# EasyEDA Pro project MSX-ROM-CARTRIDGE.epro

# Schematic MSX-ROM-CARTRIDGE
Board Name: MSX-ROM-CARTRIDGE; Create Date: 2026-04-04; Page Name: P1; Project Name: TURBO-CPU; Schematic Name: MSX-ROM-CARTRIDGE; Update Date: 2026-04-04; Version: V1.0
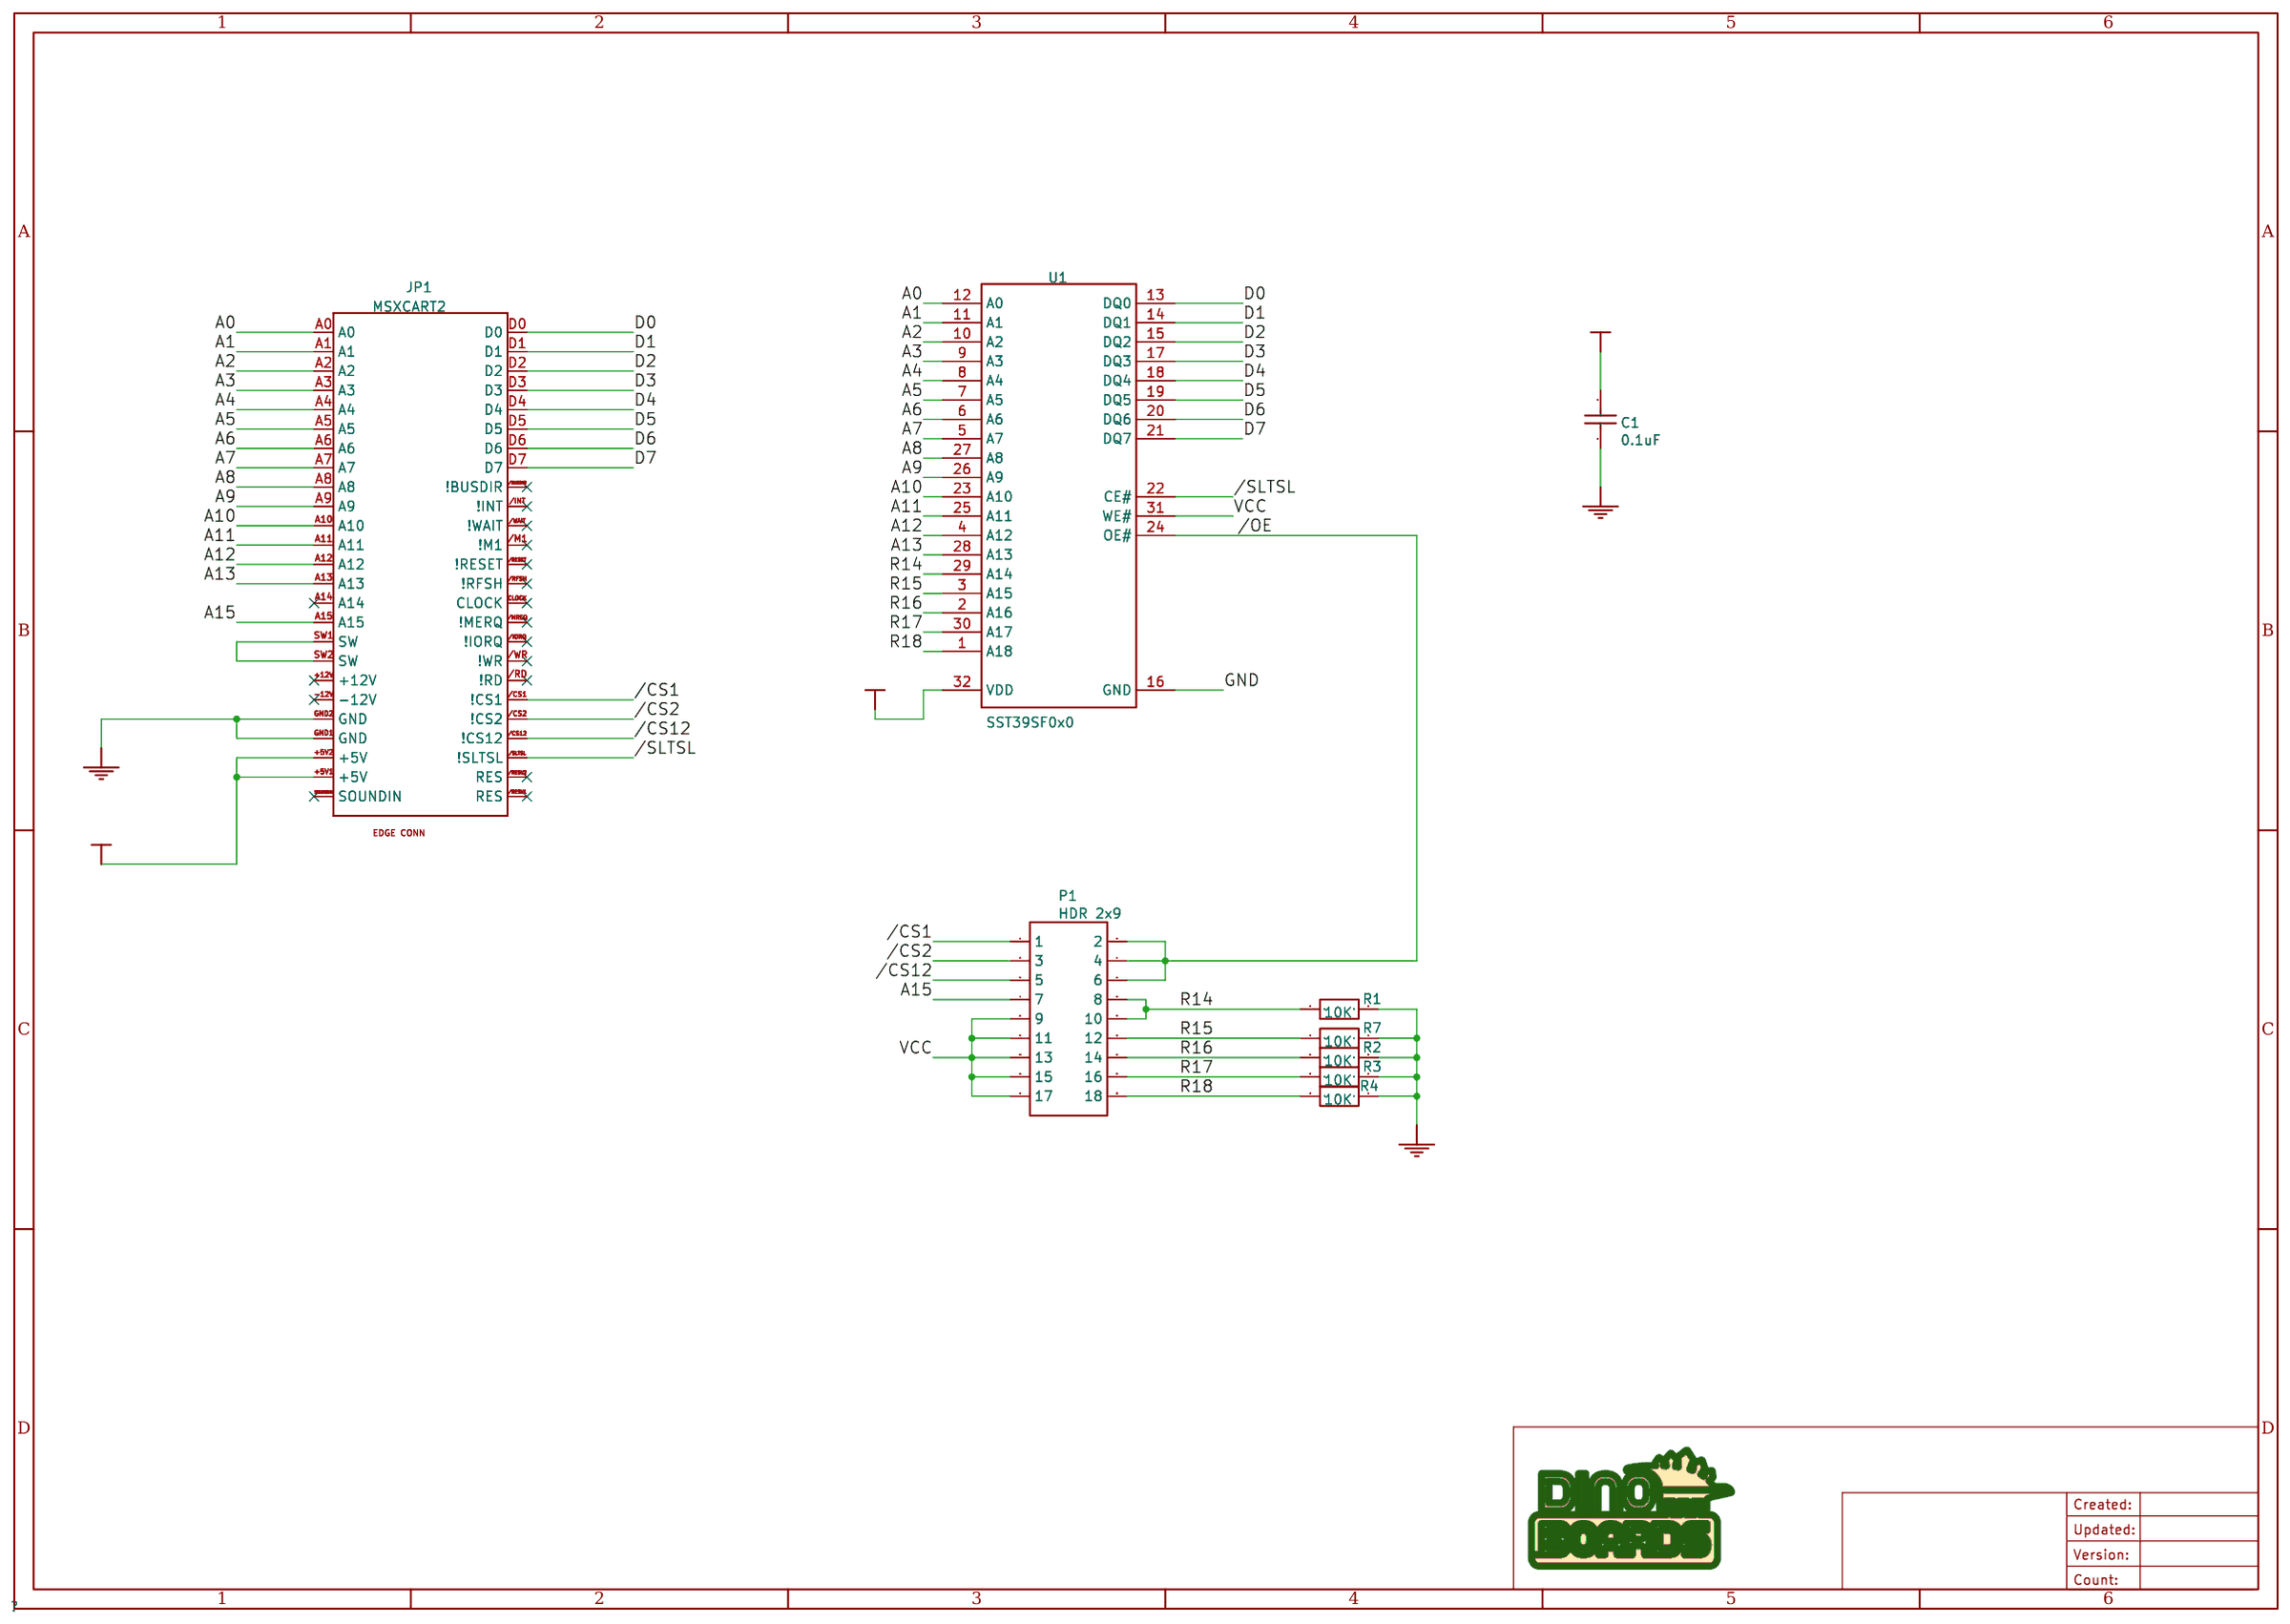
[diagram p0: schematic sheet]

## Parts
C1  0.1uF  [RAD-0.1]
JP1  MSXCART2  [DINO-MSXCART]
P1  HDR 2x9  [HDR 2X9]
R1  10K  [DINO-RESISTOR-250W]
R2  10K  [DINO-RESISTOR-250W]
R3  10K  [DINO-RESISTOR-250W]
R4  10K  [DINO-RESISTOR-250W]
R7  10K  [DINO-RESISTOR-250W]
U1  SST39SF0x0  [DINO-DIP32]

## Library data of the parts
C1 = 0.1uF: Manufacturer Part: Ceramic capacitor0.1UF50V; nameAlias: Capacitance; Contributor: dearali; spicePre: C; spiceSymbolName: SR201C104
JP1 = MSXCART2: timeStamp: 1460482699; Contributor: ageikin.v92; spicePre: J
P1 = HDR 2x9: Contributor: Alex_Tien; spicePre: P
R1-R4 R7 = 10K: nameAlias: Value(Ω); Contributor: LCEDA_Lib; spicePre: R; spiceSymbolName: R_AXIAL-0.3_EU
U1 = SST39SF0x0: spicePre: U; spiceSymbolName: SST39SF040-70-4C-PHE

## Nets
GND: C1.1 JP1.GND1(GND) JP1.GND2(GND) R1.1 R2.1 R3.1 R4.1 R7.1 U1.16(GND)
VCC: C1.2 JP1.+5V1(+5V) JP1.+5V2(+5V) P1.9 P1.11 P1.13 P1.15 P1.17 U1.31(WE#) U1.32(VDD)
/CS1: JP1./CS1(!CS1) P1.1
/CS2: JP1./CS2(!CS2) P1.3
/CS12: JP1./CS12(!CS12) P1.5
/OE: P1.2 P1.4 P1.6 U1.24(OE#)
/SLTSL: JP1./SLTSL(!SLTSL) U1.22(CE#)
A0: JP1.A0 U1.12(A0)
A1: JP1.A1 U1.11(A1)
A2: JP1.A2 U1.10(A2)
A3: JP1.A3 U1.9(A3)
A4: JP1.A4 U1.8(A4)
A5: JP1.A5 U1.7(A5)
A6: JP1.A6 U1.6(A6)
A7: JP1.A7 U1.5(A7)
A8: JP1.A8 U1.27(A8)
A9: JP1.A9 U1.26(A9)
A10: JP1.A10 U1.23(A10)
A11: JP1.A11 U1.25(A11)
A12: JP1.A12 U1.4(A12)
A13: JP1.A13 U1.28(A13)
A15: JP1.A15 P1.7
D0: JP1.D0 U1.13(DQ0)
D1: JP1.D1 U1.14(DQ1)
D2: JP1.D2 U1.15(DQ2)
D3: JP1.D3 U1.17(DQ3)
D4: JP1.D4 U1.18(DQ4)
D5: JP1.D5 U1.19(DQ5)
D6: JP1.D6 U1.20(DQ6)
D7: JP1.D7 U1.21(DQ7)
R14: P1.8 P1.10 R1.2 U1.29(A14)
R15: P1.12 R7.2 U1.3(A15)
R16: P1.14 R2.2 U1.2(A16)
R17: P1.16 R3.2 U1.30(A17)
R18: P1.18 R4.2 U1.1(A18)
$1N52: JP1.SW1(SW) JP1.SW2(SW)

Not connected (* = marked no-connect by the designer): JP1 +12V* -12V* /BUSDIR(!BUSDIR)* /INT(!INT)* /IORQ(!IORQ)* /M1(!M1)* /MREQ(!MERQ)* /RD(!RD)* /RESET(!RESET)* /RESV1(RES)* /RESV2(RES)* /RFSH(!RFSH)* /WAIT(!WAIT)* /WR(!WR)* A14* CLOCK* SOUNDIN*

# Board MSX-ROM-CARTRIDGE
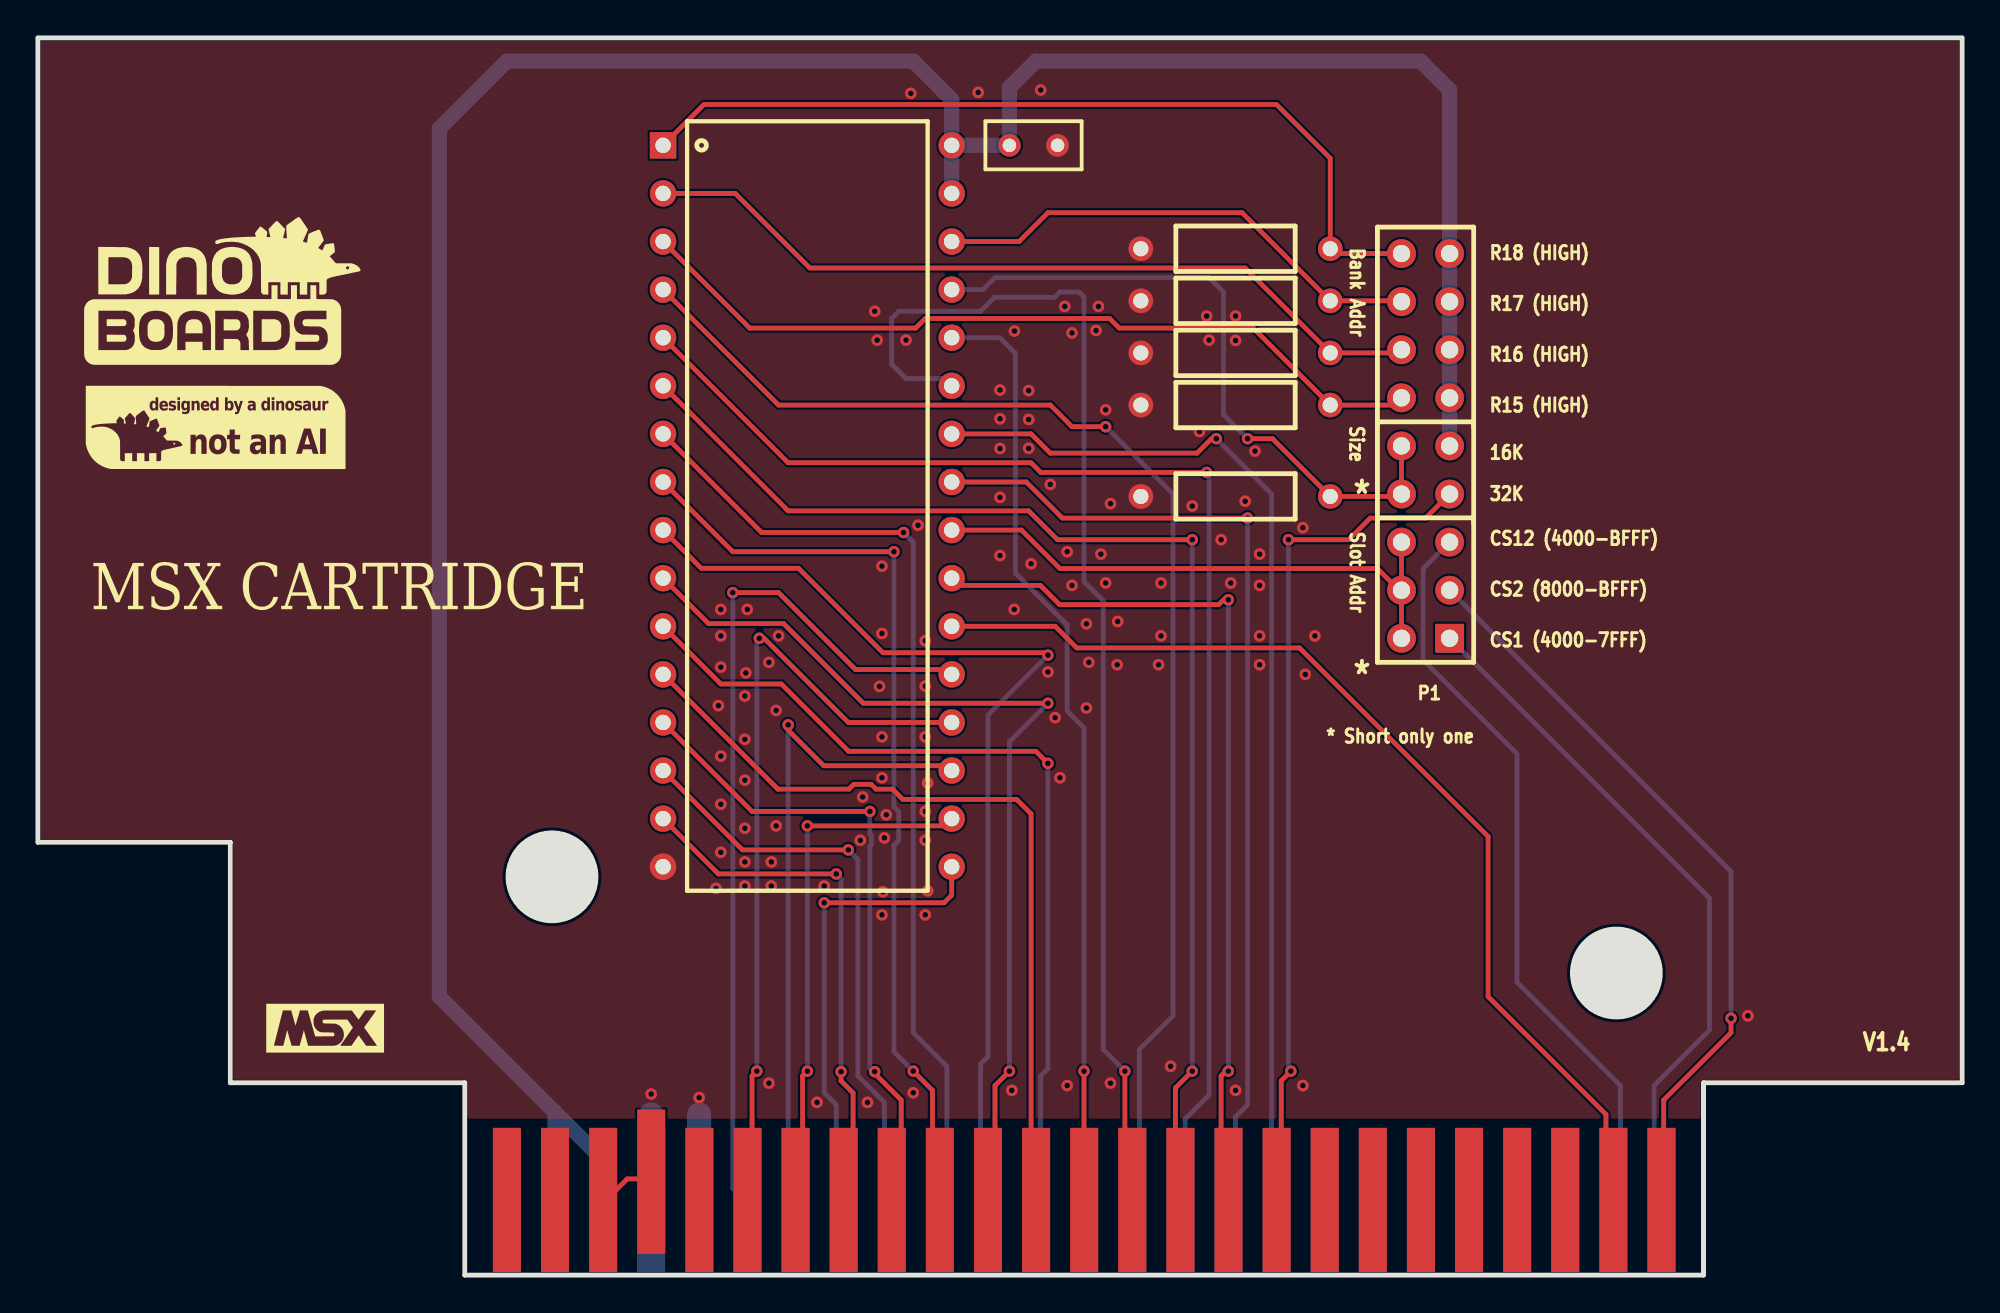
[diagram p1: board, top side]
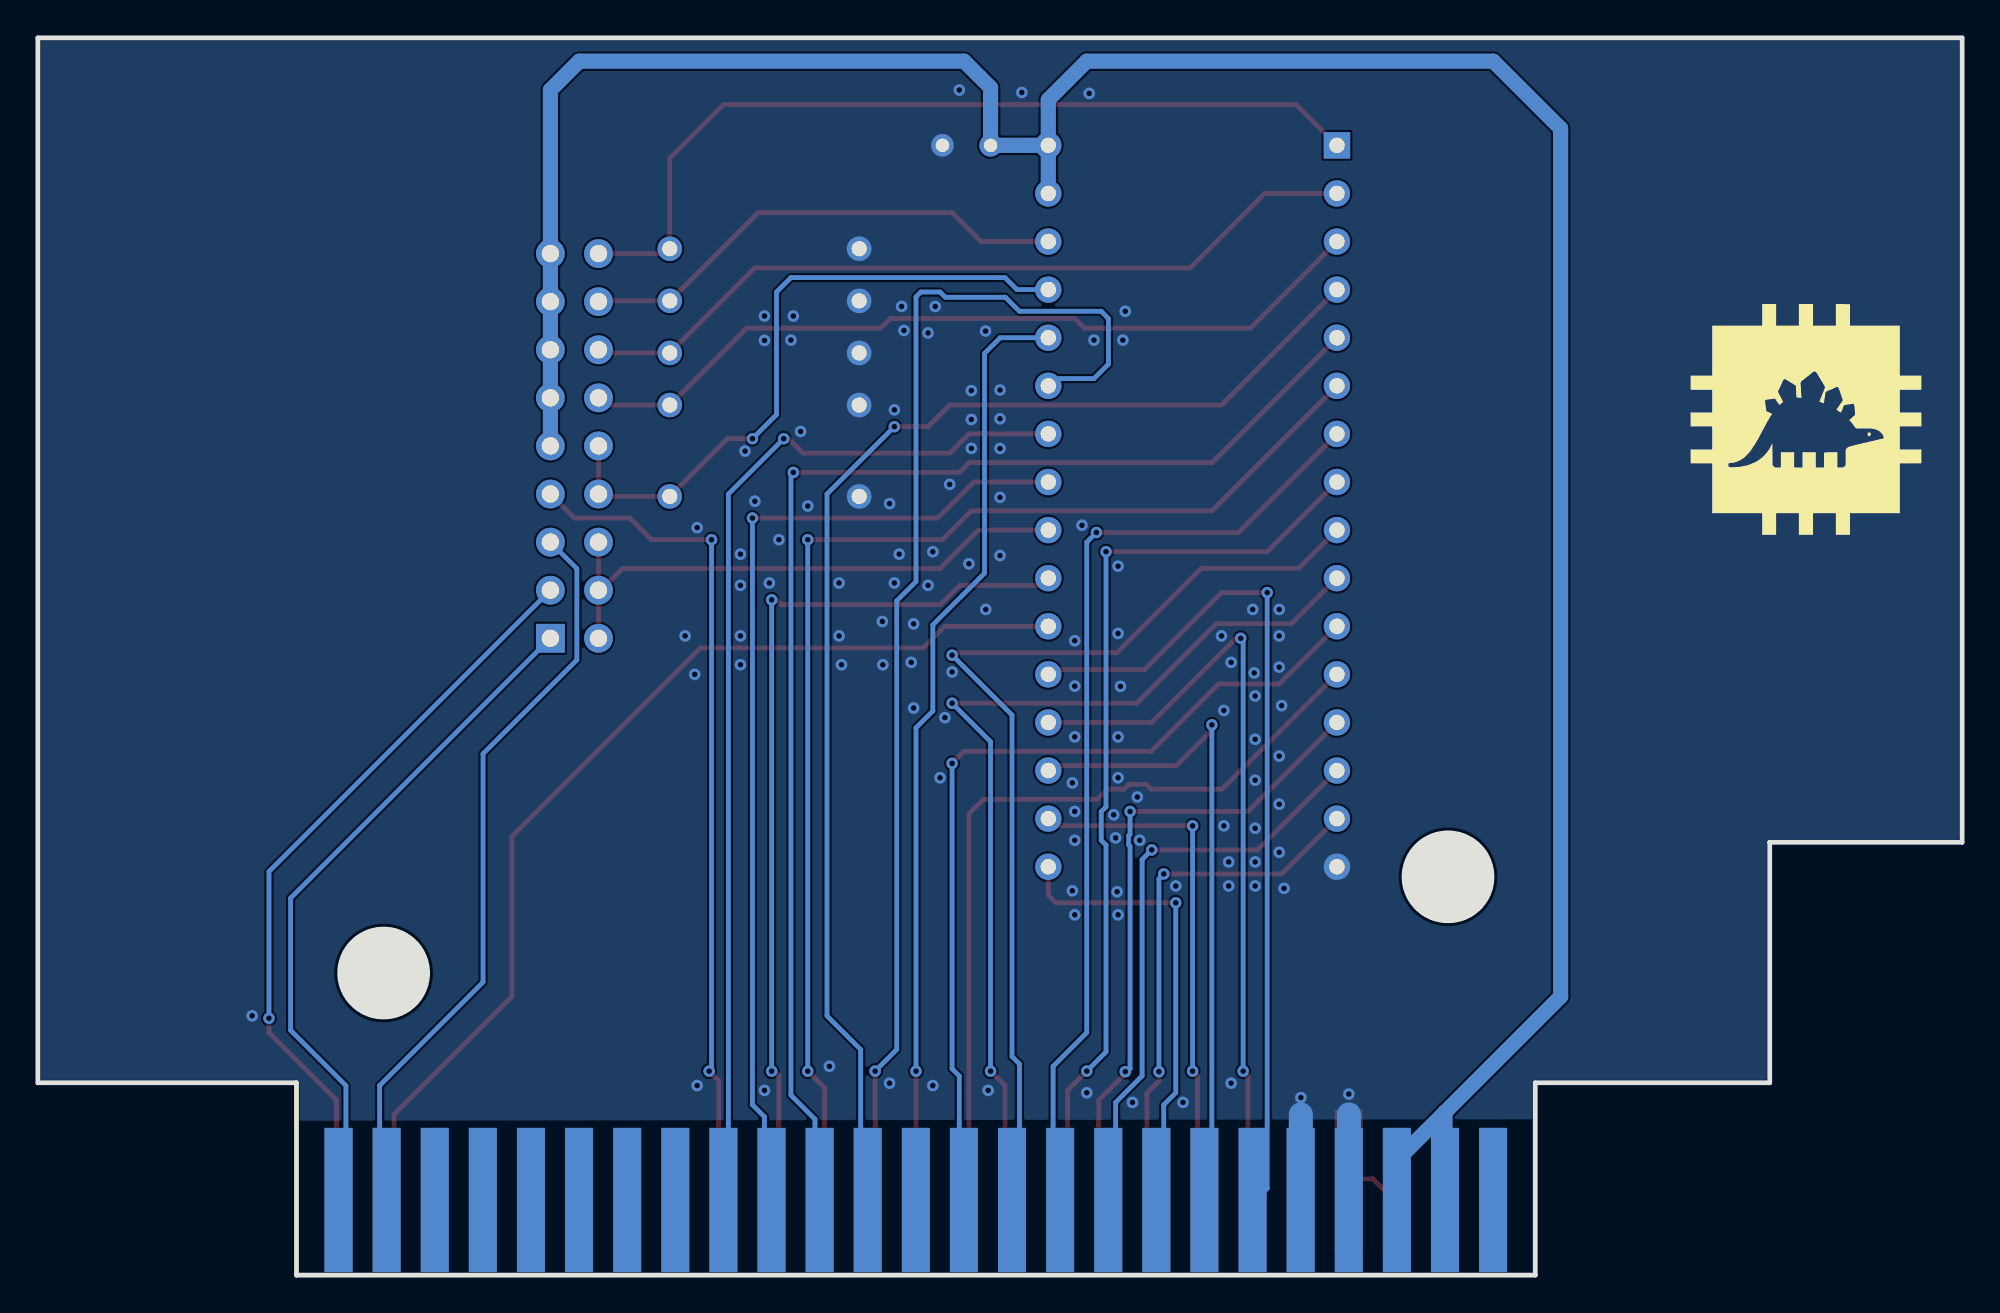
[diagram p2: board, bottom side, seen from below]

Outline 101.6 x 65.34 mm; copper layers: Top Layer, Bottom Layer. Coordinates in mm from the lower left corner of the outline.
Stack: Top Layer 0.035mm / Dielectric1 1.51mm FR4 er 4.5 / Bottom Layer 0.035mm

## Design rules (mm)
spacing Default (default): track to track 0.152, other pairs 0 to 0.152
track width Default (default): min 0.254, default 0.254, max 25.4
differential pair differentialPair (default): width min 0.127, default 0.254, max 2.54; gap min 0.152, default 0.152
via Default (default): diameter min 0.61, default 0.61, max 100.025; hole min 0.305, default 0.305, max 59.995
pour e118 uses gge217987
pour e290 uses gge217987(1)

## Placement (name value [footprint] x y rotation side)
C1  0.1uF  [RAD-0.1]  52.57 59.67 180 top
JP1  MSXCART2  [DINO-MSXCART]  54.6 32.75 0 top
P1  HDR 2x9  [HDR 2X9]  73.27 43.79 180 top
R1  10K  [DINO-RESISTOR-250W]  63.24 41.13 0 top
R2  10K  [DINO-RESISTOR-250W]  63.24 48.7 0 top
R3  10K  [DINO-RESISTOR-250W]  63.24 51.46 0 top
R4  10K  [DINO-RESISTOR-250W]  63.24 54.21 0 top
R7  10K  [DINO-RESISTOR-250W]  63.24 45.95 0 top
U1  SST39SF0x0  [DINO-DIP32]  40.63 40.62 270 top

## Footprints (pads in the part's own frame, mm; a bottom-side part is the same pattern mirrored in y, then rotated)
DINO-DIP32
  rect 1.397x1.397 hole 0.813: 1(-19.05,-7.62)
  round 1.397 hole 0.813: 2(-16.51,-7.62) 3(-13.97,-7.62) 4(-11.43,-7.62) 5(-8.89,-7.62) 6(-6.35,-7.62) 7(-3.81,-7.62) 8(-1.27,-7.62) 9(1.27,-7.62) 10(3.81,-7.62) 11(6.35,-7.62) 12(8.89,-7.62) 13(11.43,-7.62) 14(13.97,-7.62) 15(16.51,-7.62) 16(19.05,-7.62) 17(19.05,7.62) 18(16.51,7.62) 19(13.97,7.62) 20(11.43,7.62) 21(8.89,7.62) 22(6.35,7.62) 23(3.81,7.62) 24(1.27,7.62) 25(-1.27,7.62) 26(-3.81,7.62) 27(-6.35,7.62) 28(-8.89,7.62) 29(-11.43,7.62) 30(-13.97,7.62) 31(-16.51,7.62) 32(-19.05,7.62)
DINO-MSXCART
  rect 1.48x7.62 smd far side: +5V1(-27.295,-28.778) +5V2(-24.755,-28.778) /CS1(31.125,-28.778) /CS12(28.585,-28.778) /IORQ(18.425,-28.778) /M1(20.965,-28.778) /RESET(13.345,-28.778) /RESV2(26.045,-28.778) /WAIT(23.505,-28.778) /WR(15.885,-28.778) A1(-1.895,-28.778) A3(-4.435,-28.778) A5(-6.975,-28.778) A7(5.725,-28.778) A9(10.805,-28.778) A11(8.265,-28.778) A12(3.185,-28.778) A14(0.645,-28.778) D1(-9.515,-28.778) D3(-12.055,-28.778) D5(-14.595,-28.778) D7(-17.135,-28.778) GND1(-22.215,-28.778) GND2(-19.675,-28.778) SOUNDIN(-29.835,-28.778)
  rect 1.48x7.62 smd: +12V(-27.295,-28.778) -12V(-29.835,-28.778) /BUSDIR(20.965,-28.778) /CS2(31.125,-28.778) /INT(23.505,-28.778) /MREQ(18.425,-28.778) /RD(15.885,-28.778) /RESV1(13.345,-28.778) /RFSH(26.045,-28.778) /SLTSL(28.585,-28.778) A0(-1.895,-28.778) A2(-4.435,-28.778) A4(-6.975,-28.778) A6(5.725,-28.778) A8(3.185,-28.778) A10(8.265,-28.778) A13(0.645,-28.778) A15(10.805,-28.778) CLOCK(-19.675,-28.778) D0(-9.515,-28.778) D2(-12.055,-28.778) D4(-14.595,-28.778) D6(-17.135,-28.778) SW1(-22.215,-27.812) SW2(-24.755,-28.778)
DINO-RESISTOR-250W
  round 1.3 hole 0.8: 1(-5,0) 2(5,0)
HDR 2X9
  rect 1.524x1.524 hole 0.914: 1(-1.27,10.16)
  round 1.524 hole 0.914: 2(1.27,10.16) 3(-1.27,7.62) 4(1.27,7.62) 5(-1.27,5.08) 6(1.27,5.08) 7(-1.27,2.54) 8(1.27,2.54) 9(-1.27,0) 10(1.27,0) 11(-1.27,-2.54) 12(1.27,-2.54) 13(-1.27,-5.08) 14(1.27,-5.08) 15(-1.27,-7.62) 16(1.27,-7.62) 17(-1.27,-10.16) 18(1.27,-10.16)
RAD-0.1
  round 1.194 hole 0.711: 1(-1.27,0) 2(1.27,0)

## Nets
As in the schematic.

Pads without a net: JP1 +12V -12V /BUSDIR /INT /IORQ /M1 /MREQ /RD /RESET /RESV1 /RESV2 /RFSH /WAIT /WR A14 CLOCK SOUNDIN

## Via types
v1: diameter 0.61, hole 0.305, Top Layer to Bottom Layer, 145 vias

## Routing (per net, layer and track width the routed paths; a pad name or vN(x,y) marks a point on that pad's centre or on a via; arc(x,y) is an arc through that point)
GND: length 9.4
  Bottom Layer w1.27: 32.38,3.81 32.38,8.49 ; 34.92,3.81 34.91,8.49
  vias: v1(32.38,9.56) v1(34.91,9.38) v1(35.8,20.43) v1(35.93,30.08) v1(36.06,35.16) v1(36.06,33.76) v1(36.06,32.11) v1(36.06,27.41) v1(36.06,24.87) v1(36.06,22.33) v1(37.33,30.59) v1(37.33,28.3) v1(37.33,26.14) v1(37.33,23.6) v1(37.33,21.82) v1(37.33,20.55) v1(37.38,31.81) v1(37.45,35.16) v1(38.6,32.36) v1(38.6,10.14) v1(38.72,21.82) v1(38.72,20.55) v1(38.98,29.82) v1(38.98,23.73) v1(39.11,33.76) v1(41.14,9.12) v1(41.52,20.55) v1(43.42,22.97) v1(43.55,25.25) v1(43.81,9.12) v1(44.19,50.91) v1(44.31,49.38) v1(44.44,31.09) v1(44.57,37.44) v1(44.57,33.89) v1(44.57,28.43) v1(44.57,26.27) v1(44.62,20.25) v1(44.57,19.03) v1(44.69,23.09) v1(44.8,24.31) v1(45.84,49.38) v1(46.09,62.41) v1(46.22,9.63) v1(46.47,39.6) v1(46.85,33.51) v1(46.85,31.11) v1(46.85,28.43) v1(46.85,24.49) v1(46.85,22.97) v1(46.85,19.03) v1(46.98,26) v1(46.98,20.3) v1(49.65,62.46) v1(50.8,46.75) v1(50.8,45.23) v1(50.8,43.66) v1(50.8,41.08) v1(50.8,38) v1(51.42,9.76) v1(51.56,49.86) v1(51.55,35.16) v1(52.31,46.72) v1(52.31,45.19) v1(52.31,43.67) v1(52.44,37.57) v1(52.95,62.59) v1(53.33,31.86) v1(53.46,41.76) v1(53.71,29.44) v1(53.97,26.27) v1(54.22,51.16) v1(54.35,38.21) v1(54.35,10.01) v1(54.6,49.76) v1(54.6,36.43) v1(55.36,34.4) v1(55.36,29.95) v1(55.49,32.36) v1(55.87,49.89) v1(56,51.16) v1(56.12,38.08) v1(56.38,45.7) v1(56.38,36.56) v1(56.63,40.75) v1(56.63,10.14) v1(57.01,34.52) v1(56.99,32.24) v1(59.17,32.24) v1(59.3,36.56) v1(59.3,33.76) v1(59.81,11.03) v1(60.95,40.62) v1(61.33,44.56) v1(61.71,50.65) v1(61.84,49.38) v1(62.47,38.84) v1(62.98,36.56) v1(63.24,50.66) v1(63.24,49.36) v1(63.24,9.76) v1(63.74,40.87) v1(64.26,43.52) v1(64.51,38.08) v1(64.51,36.43) v1(64.51,33.76) v1(64.51,32.24) v1(66.79,39.48) v1(66.79,10.01) v1(66.92,31.73) v1(67.43,33.76) v1(90.29,13.7)
VCC: length 148.8
  Bottom Layer w0.8: P1.9 P1.13 P1.17 74.54,62.59 73.01,64.11 52.69,64.11 51.3,62.72 C1.2 U1.32 ; U1.32 U1.31 ; U1.32 48.25,62.08 46.22,64.11 24.75,64.11 21.2,60.56 21.2,14.71 27.3,8.61 ; 29.84,3.81 29.84,6.06 27.3,8.61 ; 27.3,8.61 27.3,3.81
/CS1: length 36.9
  Bottom Layer w0.254: 74.54,33.63 88.25,19.92 88.25,12.93 85.33,10.01 85.33,4.2 85.72,3.81
/CS2: length 40
  Top Layer w0.254: v1(89.4,13.57) 89.4,12.81 85.84,9.25 85.84,3.93 85.72,3.81
  Bottom Layer w0.254: v1(89.4,13.57) 89.4,21.31 P1.3
/CS12: length 40
  Bottom Layer w0.254: 74.54,38.71 73.14,37.32 73.14,32.49 78.09,27.54 78.09,15.47 83.56,10.01 83.56,4.18 83.19,3.81
/OE: length 30.1
  Top Layer w0.254: P1.4 72,33.63 ; P1.4 71.87,36.17 70.73,37.32 53.97,37.32 51.93,39.35 U1.24 ; P1.4 72,38.71
/SLTSL: length 55
  Top Layer w0.254: 83.19,3.81 82.79,4.2 82.79,8.49 76.57,14.71 76.57,23.17 66.61,33.13 54.85,33.13 53.71,34.27 U1.22
A0: length 43.5
  Top Layer w0.254: U1.12 39.07,25.67 42.82,25.67 43.08,25.92 44,25.92 44.25,25.67 45.13,25.67 45.67,25.12 51.68,25.12 52.44,24.36 52.44,3.81 52.7,3.81
A1: length 46.9
  Top Layer w0.254: U1.11 36.06,31.22 39.25,31.22 42.81,27.67 52.69,27.67 v1(53.33,27.03)
  Bottom Layer w0.254: 52.7,3.81 52.95,3.81 52.95,10.52 53.33,10.9 v1(53.33,27.03)
A2: length 51
  Top Layer w0.254: v1(53.33,30.2) 43.58,30.2 39.37,34.41 35.41,34.41 U1.10 ; 50.16,3.81 50.54,3.81 50.54,10.01 v1(51.3,10.77)
  Bottom Layer w0.254: v1(51.3,10.77) 51.3,28.17 v1(53.33,30.2)
A3: length 53.9
  Top Layer w0.254: U1.9 35.03,37.33 40.16,37.33 44.62,32.87 53.2,32.87 v1(53.33,32.75)
  Bottom Layer w0.254: v1(53.33,32.75) 50.16,29.58 50.16,11.55 49.77,11.16 49.77,3.81 50.16,3.81
A4: length 49.6
  Top Layer w0.254: v1(45.2,38.21) 36.69,38.21 U1.8 ; v1(46.22,10.77) 47.23,9.76 47.23,3.81 47.62,3.81
  Bottom Layer w0.254: v1(46.22,10.77) 45.2,11.79 45.2,22.71 45.46,22.97 45.46,24.48 45.2,24.73 v1(45.2,38.21)
A5: length 51.6
  Top Layer w0.254: v1(45.71,39.22) 38.22,39.22 U1.7
  Bottom Layer w0.254: v1(45.71,39.22) 46.22,38.71 46.22,12.81 48,11.03 48,3.81 47.62,3.81
A6: length 67
  Top Layer w0.254: 60.32,3.81 60.06,3.81 60.06,9.89 v1(60.95,10.77) ; v1(60.95,38.84) 53.84,38.84 52.31,40.37 39.61,40.37 U1.6
  Bottom Layer w0.254: v1(60.95,38.84) v1(60.95,10.77)
A7: length 71.1
  Top Layer w0.254: v1(61.71,42.4) 52.95,42.4 52.44,42.91 39.61,42.91 U1.5
  Bottom Layer w0.254: v1(61.71,42.4) 61.84,42.27 61.84,9.5 60.57,8.23 60.57,3.81 60.32,3.81
A8: length 65.8
  Top Layer w0.254: v1(57.39,10.77) 57.39,4.2 57.78,3.81
  Bottom Layer w0.254: v1(57.39,10.77) 56.25,11.92 56.25,35.62 55.23,36.63 55.23,51.67 54.98,51.92 53.97,51.92 53.69,51.64 50.51,51.64 49.77,50.91 45.46,50.91 45.07,50.53 45.07,48.11 45.84,47.35 47.87,47.35 U1.27
A9: length 56.5
  Top Layer w0.254: U1.26 52.44,44.43 53.46,43.41 61.2,43.41 61.97,44.18 v1(62.22,44.18)
  Bottom Layer w0.254: 65.41,3.81 65.14,3.81 65.14,41.25 v1(62.22,44.18)
A10: length 47.8
  Top Layer w0.254: 62.86,3.81 62.47,3.81 62.47,10.52 62.73,10.77 v1(62.85,10.77) ; v1(62.85,35.67) 62.6,35.67 62.35,35.41 53.94,35.41 52.93,36.43 48.63,36.43 U1.23
  Bottom Layer w0.254: v1(62.85,35.67) v1(62.85,10.77)
A11: length 53.2
  Top Layer w0.254: v1(63.87,39.98) 54.09,39.98 52.19,41.89 U1.25
  Bottom Layer w0.254: 62.86,3.81 63.24,3.81 63.24,8.36 63.87,9 v1(63.87,39.98)
A12: length 69.9
  Top Layer w0.254: v1(56.38,44.81) 54.6,44.81 53.46,45.95 39.11,45.95 U1.4
  Bottom Layer w0.254: v1(56.38,44.81) 59.93,41.25 59.93,13.7 58.16,11.92 58.16,3.81 57.78,3.81
A13: length 50.1
  Top Layer w0.254: v1(55.23,10.77) 55.23,3.82 55.25,3.81
  Bottom Layer w0.254: v1(55.23,10.77) 55.23,28.91 54.35,29.79 54.35,34.34 51.62,37.07 51.62,48.68 50.79,49.51 U1.28
A15: length 45
  Top Layer w0.254: v1(66.03,38.84) 69.2,38.84 70.35,39.98 73.27,39.98 P1.7 ; 65.41,3.81 65.65,3.81 65.65,10.27 v1(66.16,10.77)
  Bottom Layer w0.254: v1(66.16,10.77) 66.03,10.9 v1(66.03,38.84)
D0: length 34.8
  Top Layer w0.254: v1(43.93,24.49) 37.71,24.49 U1.13 ; 45.09,3.81 45.58,3.81 45.58,9.25 44.19,10.65
  Bottom Layer w0.254: 44.19,10.65 43.93,10.9 43.93,22.65 44.01,22.72 44.01,23.21 43.93,23.28 v1(43.93,24.49)
  vias: v1(44.19,10.75)
D1: length 31.3
  Top Layer w0.254: v1(42.79,22.46) 37.2,22.46 U1.14
  Bottom Layer w0.254: 45.09,3.81 44.69,3.81 44.69,9.12 43.3,10.52 43.3,21.95 v1(42.79,22.46)
D2: length 28.6
  Top Layer w0.254: v1(42.41,10.75) 42.41,10.25 43.04,9.62 43.04,3.81 42.53,3.81 ; v1(42.15,21.19) 35.93,21.19 U1.15
  Bottom Layer w0.254: v1(42.15,21.19) 42.41,20.93 v1(42.41,10.75)
D3: length 24.9
  Top Layer w0.254: U1.17 48.25,20.07 47.85,19.66 v1(41.52,19.66)
  Bottom Layer w0.254: v1(41.52,19.66) 41.52,9.63 42.15,9 42.15,3.81 42.54,3.81
D4: length 28.2
  Top Layer w0.254: v1(40.63,10.77) 40.38,10.52 40.38,3.81 40,3.81 ; v1(40.63,23.73) 47.87,23.73 U1.18
  Bottom Layer w0.254: v1(40.63,23.73) v1(40.63,10.77)
D5: length 35.4
  Top Layer w0.254: v1(39.61,29.06) 39.61,28.78 41.49,26.9 48,26.9 U1.19
  Bottom Layer w0.254: v1(39.61,29.06) 39.61,3.81 40,3.81
D6: length 42.2
  Top Layer w0.254: v1(38.09,33.63) 38.34,33.63 42.79,29.19 U1.20 ; v1(37.96,10.77) 37.71,10.52 37.71,3.81 37.47,3.81
  Bottom Layer w0.254: v1(38.09,33.63) 37.96,33.51 v1(37.96,10.77)
D7: length 45.9
  Top Layer w0.254: U1.21 48,31.98 43.17,31.98 39.11,36.05 v1(36.69,36.05)
  Bottom Layer w0.254: v1(36.69,36.05) 36.69,4.58 37.47,3.81
R14: length 35.2
  Top Layer w0.254: v1(63.87,44.18) 65.19,44.18 R1.2 71.87,41.13 P1.8 P1.10
  Bottom Layer w0.254: v1(63.87,44.18) 62.6,45.45 62.6,51.92 61.84,52.68 50.54,52.68 49.9,52.05 U1.29
R15: length 43.1
  Top Layer w0.254: 72,46.33 71.62,45.95 68.24,45.95 64.17,50.02 57.1,50.02 56.59,50.53 46.85,50.53 46.34,50.02 37.58,50.02 U1.3
R16: length 42.5
  Top Layer w0.254: U1.2 36.82,57.13 40.76,53.19 63.75,53.19 R2.2 71.83,48.7 P1.14
R17: length 26.3
  Top Layer w0.254: U1.30 51.81,54.59 53.33,56.11 63.58,56.11 R3.2 71.96,51.46 72,51.41
R18: length 45.9
  Top Layer w0.254: U1.1 35.17,61.83 65.39,61.83 68.24,58.99 R4.2 68.49,53.95 P1.18
$1N52: length 3.1
  Top Layer w0.254: 32.38,5.08 31.11,5.08 29.84,3.81

## Copper pours and planes (outline as drawn; the poured copper is in the pictures)
GND on Top Layer: -0.9,66.78 102.48,66.53 102.99,8.36 -2.93,8.36
GND on Bottom Layer: -1.92,67.04 102.86,67.04 105.27,8.23 -3.06,8.36

## Text on the board
Top Silkscreen Layer: * Short only one | R18 (HIGH) | R17 (HIGH) | R16 (HIGH) | R15 (HIGH) | 16K | 32K | CS12 (4000-BFFF) | CS2 (8000-BFFF) | CS1 (4000-7FFF) | Size | Bank Addr | Slot Addr | V1.4 | * | MSX CARTRIDGE
